# Altium schematic sheet Top-Sheet.SchDoc
size 420 x 297 mm; SheetNumber: 1; SheetTotal: 4
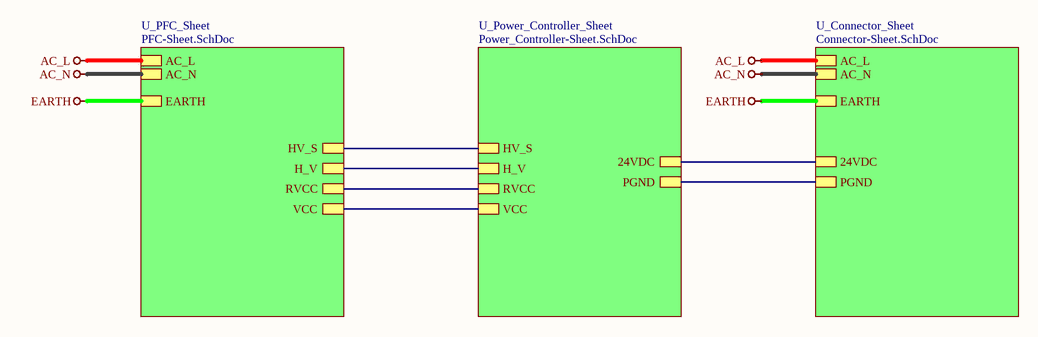
[diagram p0: Top-Sheet.SchDoc]

## Sub-sheets
U_Connector_Sheet = Connector-Sheet.SchDoc: AC_L, EARTH, AC_N, 24VDC, PGND
U_PFC_Sheet = PFC-Sheet.SchDoc: AC_L, EARTH, AC_N, HV_S, H_V, RVCC, VCC
U_Power_Controller_Sheet = Power_Controller-Sheet.SchDoc: 24VDC, PGND, HV_S, H_V, RVCC, VCC

## Nets
AC_L: sheet U_PFC_Sheet/AC_L, sheet U_Connector_Sheet/AC_L
AC_N: sheet U_PFC_Sheet/AC_N, sheet U_Connector_Sheet/AC_N
EARTH: sheet U_PFC_Sheet/EARTH, sheet U_Connector_Sheet/EARTH
(unnamed): sheet U_Power_Controller_Sheet/24VDC, sheet U_Connector_Sheet/24VDC
(unnamed): sheet U_Power_Controller_Sheet/PGND, sheet U_Connector_Sheet/PGND
(unnamed): sheet U_Power_Controller_Sheet/HV_S, sheet U_PFC_Sheet/HV_S
(unnamed): sheet U_Power_Controller_Sheet/H_V, sheet U_PFC_Sheet/H_V
(unnamed): sheet U_Power_Controller_Sheet/RVCC, sheet U_PFC_Sheet/RVCC
(unnamed): sheet U_Power_Controller_Sheet/VCC, sheet U_PFC_Sheet/VCC

## Notes on the sheet
- File:
- Title:
- Date:
- Page
- Num:
- Total:
- Drawn By: Huzaifa Ali